# Altium schematic sheet MCU BLE.SchDoc
size Letter; SheetNumber: 4; SheetTotal: 7
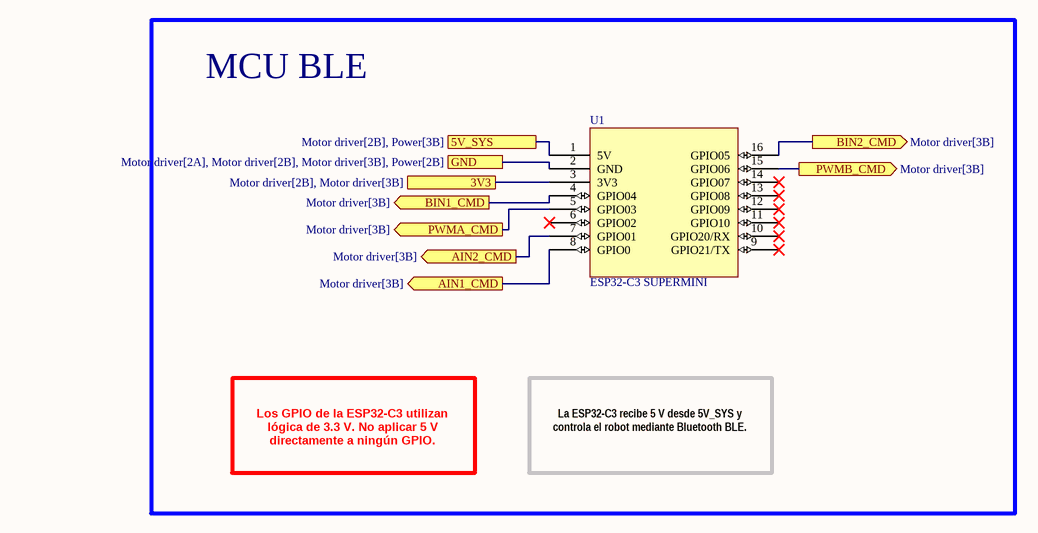
[diagram p0: MCU BLE.SchDoc]

## Parts
U1  ESP32-C3 SUPERMINI  [ESP32C3SUPERMINI]

## Blocks framed on the sheet
MCU BLE: U1

## Ports
3V3 (see Motor driver[2B], Motor driver[3B]), 5V_SYS (see Motor driver[2B], Power[3B]), AIN1_CMD (out, see Motor driver[3B]), AIN2_CMD (out, see Motor driver[3B]), BIN1_CMD (out, see Motor driver[3B]), BIN2_CMD (out, see Motor driver[3B]), GND (see Motor driver[2A], Motor driver[2B], Motor driver[3B], Power[2B]), PWMA_CMD (out, see Motor driver[3B]), PWMB_CMD (out, see Motor driver[3B])

## Nets
3V3: U1.3(3V3) ; port 3V3
5V_SYS: U1.1(5V) ; port 5V_SYS
AIN1_CMD: U1.8(GPIO0) ; port AIN1_CMD
AIN2_CMD: U1.7(GPIO01) ; port AIN2_CMD
BIN1_CMD: U1.4(GPIO04) ; port BIN1_CMD
BIN2_CMD: U1.16(GPIO05) ; port BIN2_CMD
GND: U1.2(GND) ; port GND
PWMA_CMD: U1.5(GPIO03) ; port PWMA_CMD
PWMB_CMD: U1.15(GPIO06) ; port PWMB_CMD

Not connected (* = marked no-connect by the designer): U1 6(GPIO02)* 9(GPIO21/TX)* 10(GPIO20/RX)* 11(GPIO10)* 12(GPIO09)* 13(GPIO08)* 14(GPIO07)*

## Notes on the sheet
- Los GPIO de la ESP32-C3 utilizan lógica de 3.3 V. No aplicar 5 V directamente a ningún GPIO.
- La ESP32-C3 recibe 5 V desde 5V_SYS y controla el robot mediante Bluetooth BLE.
- Proyecto:
- Autor:
- Carné:
- Documento:
- Curso:
- Revision:
- Fecha:
- Tamaño:
- Carta
- Hoja:      de

## Library data of the parts
U1 = ESP32-C3 SUPERMINI: ESP32-C3 SUPERMINI V1.0